# EasyEDA Pro project mainboard_c3_2026-10-25.epro

# Schematic Schematic1
Assembly Variant: Basic; Board Name: Board1; Create Date: 2026-08-22; Page Name: P1; Project Name: EMG_ESP32_Board; Schematic Name: Schematic1; Update Date: 2026-08-22; Company: 嘉立创EDA; Page Size: A4; Version: V1.0
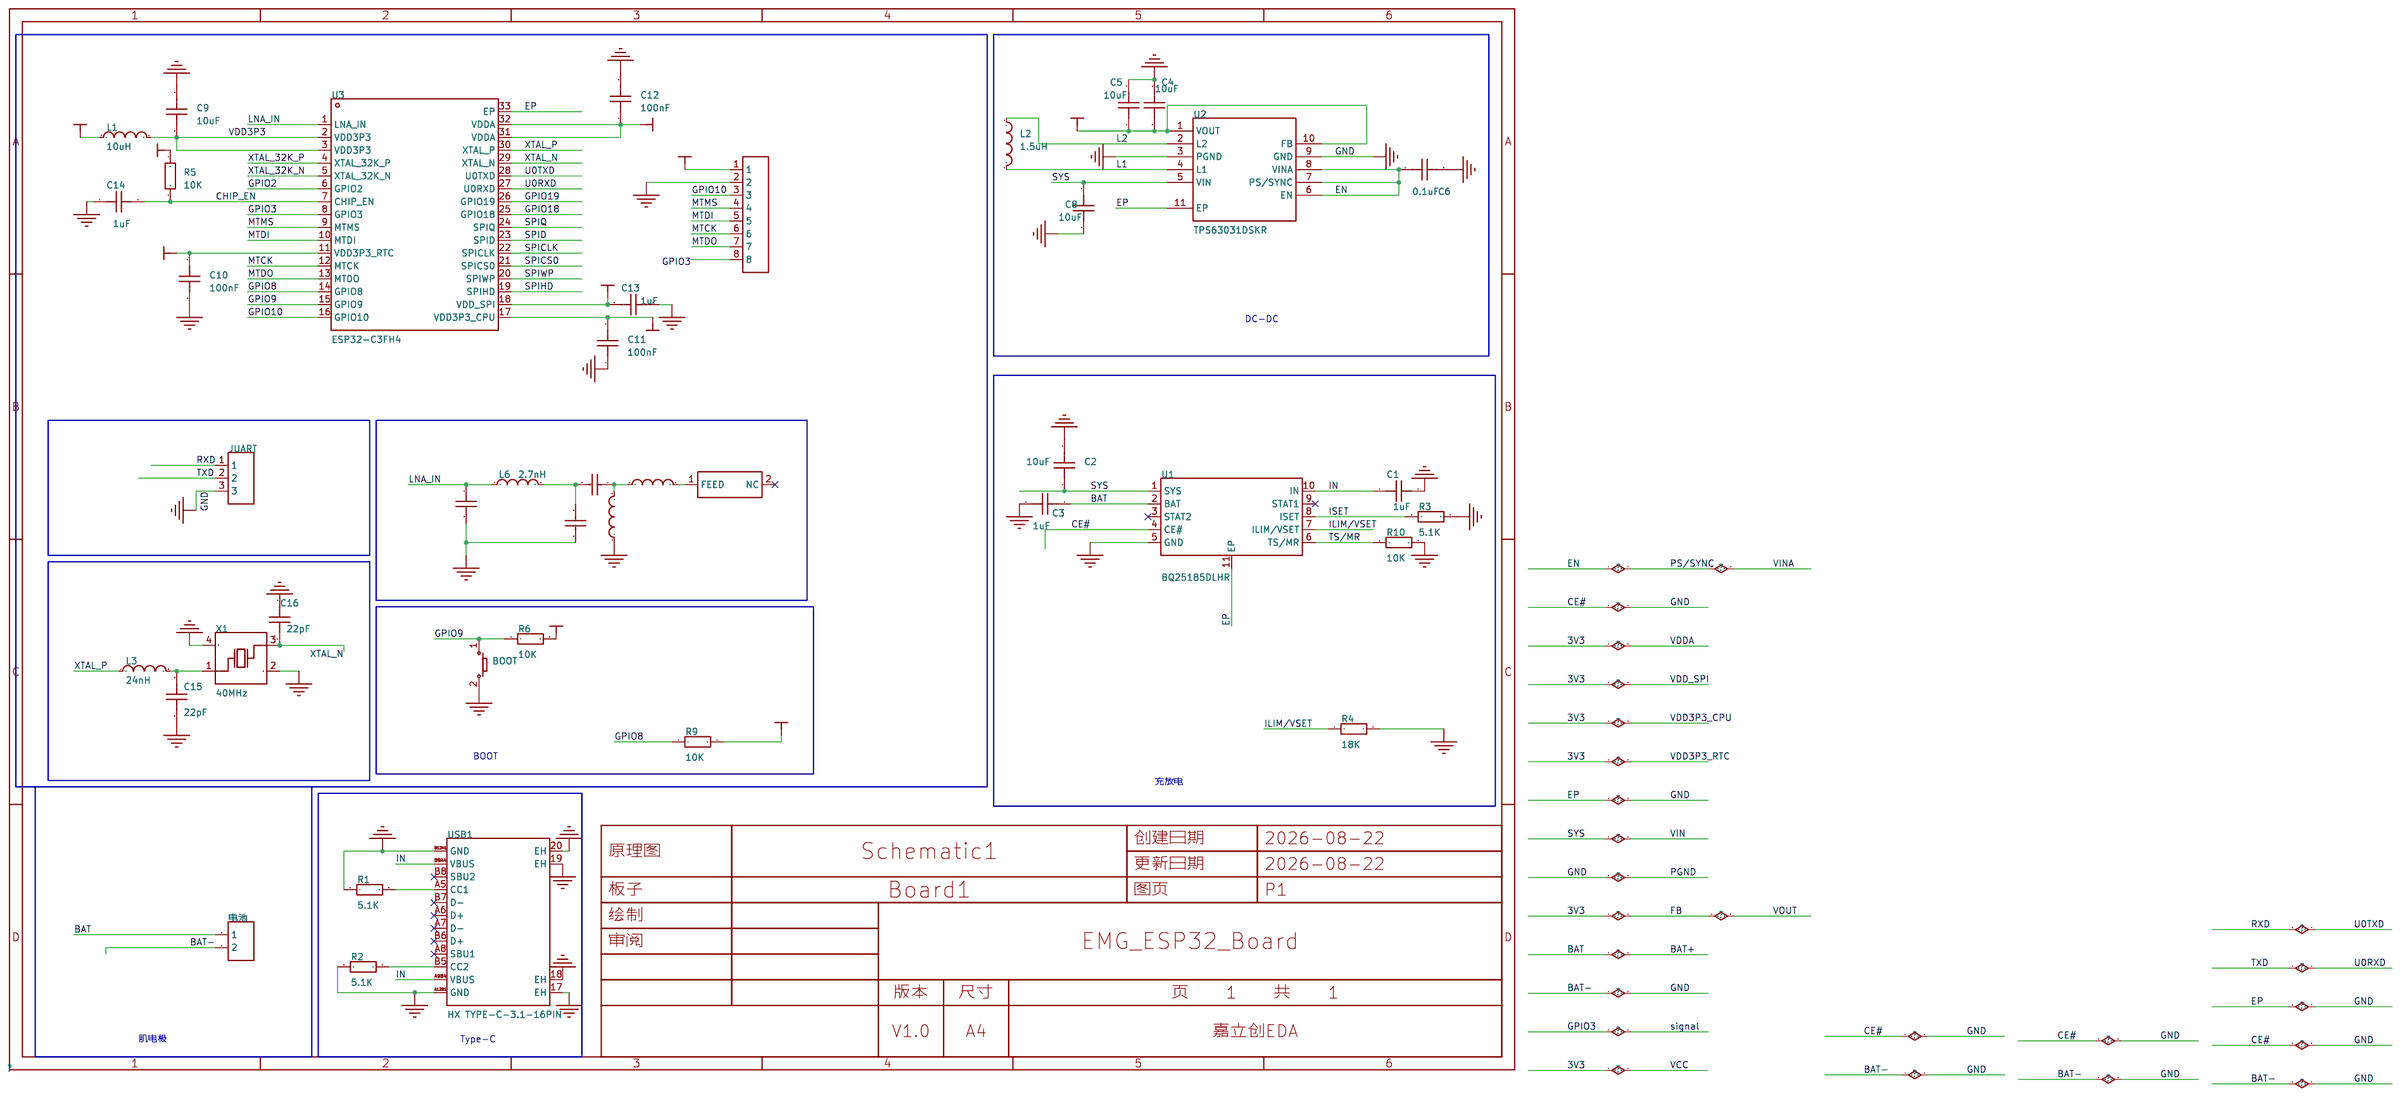
[diagram p0: schematic sheet]

## Parts
BOOT  -  [Key_SMD_3x4x2]
C1  1uF  [C0603]
C2  10uF  [C0603]
C3  1uF  [C0603]
C4  10uF  [C0603]
C5  10uF  [C0603]
C6  0.1uF  [C0603]
C7  1.2pF  [C0402]
C8  10uF  [C0603]
C9  10uF  [C0603]
C10  100nF  [C0603]
C11  100nF  [C0603]
C12  100nF  [C0603]
C13  1uF  [C0603]
C14  1uF  [C0603]
C15  22pF  [C0603]
C16  22pF  [C0603]
C18  1.2pF  [C0402]
C19  1.2pF  [C0402]
H1  -  [HDR-TH_8P-P2.54-V-F-1]
JUART  -  [HDR-TH_3P-P2.54-V-F]
L1  10uH  [IND-SMD_L4.0-W4.0_FNR40XXS]
L2  1.5uH  [L0603]
L3  24nH  [L0603]
L4  2450AT18B0100001E  [ANT-SMD_L3.2-W1.6]
L5  2.7nH  [L0402]
L6  2.7nH  [L0201]
R1  5.1K  [R0603]
R2  5.1K  [R0603]
R3  5.1K  [R0603]
R4  18K  [R0603]
R5  10K  [R0603]
R6  10K  [R0603]
R9  10K  [R0603]
R10  10K  [R0603]
U1  BQ25185DLHR  [WSON-10_L2.2-W2.0-P0.40-BL-EP_TI_DLH0010A]
U2  TPS63031DSKR  [SON-10_L2.5-W2.5-P0.50-TL-EP]
U3  ESP32-C3FH4  [QFN-32_L5.0-W5.0-P0.50-TL-EP3.7]
U4  3.3nH  [L0402]
USB1  HX TYPE-C-3.1-16PIN  [TYPE-C-SMD_HX-TYPE-C-16PIN]
X1  40MHz  [OSC-SMD_4P-L3.2-W2.5-BL_SIT8008BI]
电池  -  [HDR-TH_2P-P2.54-V-F]

## Library data of the parts
BOOT = Key_SMD_3x4x2: Supplier Footprint: SMD
C1-C6 C8-C16 = CAP_0603: Supplier Footprint: 0603
C7 C18 C19 = GJM1555C1H1R2WB01D: 容值:1.2pF;额定电压:50V;材质(温度系数):C0G;; LCSC Part Name: 1.2pF 50V; Supplier Part: C76899; Manufacturer: muRata(村田); Supplier Footprint: 0402; JLCPCB Part Class: Extended Part; Datasheet: https://atta.szlcsc.com/upload/public/pdf/source/20180326/C76899_D46909C5BA6C0CCEF2691B3FE0C3732C.pdf; Supplier: LCSC; Voltage Rated: 50V; Temperature Coefficient: C0G
H1 = HDR-F_2.54_1x8P: Supplier Part: C27438; Supplier Footprint: 插件
JUART = HDR-F_2.54_1x3P: Supplier Part: C541850; Supplier Footprint: 插件
L1 = FNR4030S100MT: 电感值:10uH;精度:±20%;额定电流:1.6A;饱和电流(Isat):2.4A;类型:磁胶屏蔽电感;; LCSC Part Name: 10uH ±20% 2.4A; Supplier Part: C167879; Manufacturer: cjiang(长江微电); Supplier Footprint: SMD,4x4mm; JLCPCB Part Class: Extended Part; Datasheet: https://item.szlcsc.com/datasheet/FNR4030S100MT/179262.html; Supplier: LCSC; Tolerance: ±20%; Current Rating: 1.6A; Current - Saturation(Isat): 2.4A; DC Resistance(DCR): 130mΩ; Type: 磁胶屏蔽电感
L2 L3 = L_0603
L4 = 2450AT18B0100001E: 天线类型:贴片天线;中心频率:2.45GHz;带宽:100MHz;增益:0.5dBi;功率:2W;; LCSC Part Name: 2.4GHz微型天线; Supplier Part: C6055600; Manufacturer: JOHANSON(约翰逊); Supplier Footprint: 1206; JLCPCB Part Class: Extended Part; Datasheet: https://item.szlcsc.com/datasheet/2450AT18B0100001E/6994739.html; Supplier: LCSC; Antenna Type: 贴片天线; Frequency(Center/Band): 2.45GHz; Bandwidth: 100MHz; Peak Gain: 0.5dBi; Impedance: 50Ω; Power: 2W; Operating Temperature: -45℃~+125℃; Length: 3.2mm; Width: 1.6mm; Height: 1.3mm
L5 = L-07C2N7SV6T: 电感值:2.7nH;精度:-;额定电流:300mA;饱和电流(Isat):-;直流电阻(DCR):170mΩ;; LCSC Part Name: 2.7nH 停产; Supplier Part: C2041435; Manufacturer: JOHANSON(约翰逊); Supplier Footprint: 0402; JLCPCB Part Class: Extended Part; Datasheet: https://item.szlcsc.com/datasheet/L-07C2N7SV6T/2132998.html; Supplier: LCSC; Current Rating: 300mA; DC Resistance(DCR): 170mΩ; Q @ Frequency: 8@100MHz; Frequency - Self Resonant: 21GHz; Type: 叠层电感
L6 = LQP03HQ2N7B02D: 电感值:2.7nH;额定电流:600mA;直流电阻(DCR):120mΩ;; LCSC Part Name: 2.7nH ±0.1nH; Supplier Part: C7216765; Manufacturer: muRata(村田); Supplier Footprint: 0201; JLCPCB Part Class: Extended Part; Datasheet: https://atta.szlcsc.com/upload/public/pdf/source/20230811/31877CD0D20902341EF7CE957B930534.pdf; Supplier: LCSC; Rated Current: 600mA; DC Resistance (DCR): 120mΩ; Q @ Freq: 20@500MHz; Frequency - Self Resonant: 9GHz
R1-R6 R9 R10 = Res_0603: Supplier Footprint: 0603
U1 = BQ25185DLHR: 工作电压:3V~18V;最大充电电流:1A;电池类型:锂电池；磷酸铁锂电池;电池节数:1;; LCSC Part Name: 单节1A独立线性电池充电器，具备电源路径、工厂模式和电池跟踪功能; Supplier Part: C19725033; Manufacturer: TI(德州仪器); Supplier Footprint: WSON-10-EP(2.2x2); JLCPCB Part Class: Extended Part; Datasheet: https://www.ti.com.cn/cn/lit/ds/symlink/bq25185.pdf?ts=1739415017761&ref_url=https%253A%252F%252Fwww.ti.com.cn%252Fproduct%252Fcn%252FBQ25185%253FkeyMatch%253Dbq25185%2526tisearch%253Duniversal_search; Supplier: LCSC; The Chip Type: 充电芯片; Voltage - Supply: 3V~18V; Charge Current - Max: 1A; Charging Saturation Voltage: 4.4V; End-Off Voltage: 2.2V; Type of Battery: 锂电池；磷酸铁锂电池; Number of Cells: 1; Operating Temperature: -40℃~+125℃; Battery Temperature Detection: 支持; Supply Current (Iq): 4uA
U2 = TPS63031DSKR: 功能类型:升降压型;工作电压:1.8V~5.5V;输出电压:3.3V;输出电流:900mA;输出类型:固定;; LCSC Part Name: 升降压型 900mA 1.8V~5.5V; Supplier Part: C15516; Manufacturer: TI(德州仪器); Supplier Footprint: SON-10-EP(2.5x2.5); JLCPCB Part Class: Extended Part; Datasheet: https://www.ti.com/cn/lit/gpn/tps63031; Supplier: LCSC; Function: 升降压型; Voltage - Supply: 1.8V~5.5V; Output Voltage: 3.3V; Output Current: 900mA; Frequency - Switching: 2.4MHz; Operating Temperature: -40℃~+125℃@(TJ); Synchronous Rectifier: 是; Number of Outputs: 1; Topology: 降压-升压式; Quiescent Current: 25uA; Switch tube (built-in/external): 内置; Output Type: 固定; Features: 轻载高效模式；频率同步；过流保护；负载断开
U3 = ESP32-C3FH4: ESP32-C3 是一款低功耗、高集成度的 MCU 系统级芯片 (SoC)，集成 2.4 GHz Wi-Fi 和低功耗蓝牙 (Bluetooth®LE) 无线通信。; LCSC Part Name: 不带固件 ESP32-C3 是一款低功耗、高集成度的 MCU 系统级芯片 (SoC)，集成 2.4 GHz Wi-Fi 和低功耗蓝牙 (Bluetooth® LE) 无线通信。; Supplier Part: C2858491; Manufacturer: ESPRESSIF(乐鑫); Supplier Footprint: QFN-32-EP(5x5); JLCPCB Part Class: Extended Part; Datasheet: https://item.szlcsc.com/datasheet/ESP32-C3FH4/3060870.html; Supplier: LCSC
U4 = LRC0402CS3N3GV001T: 电感值:3.3nH;精度:-;额定电流:300mA;饱和电流(Isat):-;直流电阻(DCR):190mΩ;; LCSC Part Name: ±0.3nH 旧型号：L-07C3N3SV6T; Supplier Part: C5338661; Manufacturer: JOHANSON(约翰逊); Supplier Footprint: 0402; JLCPCB Part Class: Extended Part; Datasheet: https://item.szlcsc.com/datasheet/LRC0402CS3N3GV001T/6106478.html; Supplier: LCSC; Current Rating: 300mA; DC Resistance(DCR): 190mΩ; Q @ Frequency: 8@100MHz; Frequency - Self Resonant: 8.5GHz; Type: 叠层电感
USB1 = HX TYPE-C-3.1-16PIN: 连接器类型:Type-C;协议标准:USB 3.1;公母:母;安装方式:卧贴;触点数量:16P;端口数量:1;额定电流 - 电源:3A;工作温度:-30℃~+80℃;; LCSC Part Name: Type-C 母 卧贴; Supplier Part: C18357551; Manufacturer: hanxia(韩下); Supplier Footprint: SMD; JLCPCB Part Class: Extended Part; Datasheet: https://item.szlcsc.com/datasheet/HX%2520TYPE-C-3.1-16PIN/19545721.html; Supplier: LCSC; Connector Type: Type-C; Protocol Standard: USB 3.1; Gender: 母; Mounting Type: 卧贴; Number of Contacts: 16P; Number of Ports: 1; Current Rating-Power: 3A; Voltage Rating: 20V; Connect-Disconnect Life: 1万次; Center Height: 1.68mm; Length: 7.35mm; Detection color: 黑色; Operating Temperature: -30℃~+80℃
X1 = X322540MPB4SI: 晶振类型:贴片晶振;频率:40MHz;常温频差:±10ppm;负载电容:15pF;频率稳定度:±20ppm;; LCSC Part Name: YSX321SL 40MHZ 4P 3225 15PF ±10PPM -40~85℃ (±20PPM); Supplier Part: C9010; Manufacturer: YXC(扬兴晶振); Supplier Footprint: SMD3225-4P; JLCPCB Part Class: Extended Part; Datasheet: https://item.szlcsc.com/datasheet/X322540MPB4SI/9530.html; Supplier: LCSC; Type: 贴片晶振; Normal temperature Frequency Tolerance: ±10ppm; Load Capacitance: 15pF; Frequency Stability: ±20ppm; Equivalent Series Resistance(ESR): 40Ω; Operating Temperature: -40℃~+85℃
电池 = HDR-F_2.54_1x2P: Supplier Part: C49661; Supplier Footprint: 插件

## Nets
3V3: C4.1 C5.1 C10.2 C11.2 C12.1 C13.2 H1.1 L1.1 R5.1 R6.2 R9.2 U2.1(VOUT) U2.10(FB) U3.11(VDD3P3_RTC) U3.17(VDD3P3_CPU) U3.18(VDD_SPI) U3.31(VDDA) U3.32(VDDA)
GND: BOOT.2 C1.2 C2.2 C3.1 C4.2 C5.2 C6.2 C8.1 C9.2 C10.1 C11.1 C12.2 C13.1 C14.1 C15.2 C16.2 C18.2 C19.2 H1.2 JUART.3 L5.1 R1.1 R2.1 R3.2 R4.2 R10.2 U1.4(CE#) U1.5(GND) U1.11(EP) U2.3(PGND) U2.9(GND) U2.11(EP) U3.33(EP) USB1.17(EH) USB1.18(EH) USB1.19(EH) USB1.20(EH) USB1.A12B1(GND) USB1.B12A1(GND) X1.2(GND) X1.4(GND) 电池.2
VDD3P3: C9.1 L1.2 U3.2(VDD3P3) U3.3(VDD3P3)
BAT: C3.2 U1.2(BAT) 电池.1
CHIP_EN: C14.2 R5.2 U3.7(CHIP_EN)
EN: C6.1 U2.6(EN) U2.7(PS/SYNC) U2.8(VINA)
GPIO2: U3.6(GPIO2)
GPIO3: H1.8 U3.8(GPIO3)
GPIO8: R9.1 U3.14(GPIO8)
GPIO9: BOOT.1 R6.1 U3.15(GPIO9)
GPIO10: H1.3 U3.16(GPIO10)
GPIO18: U3.25(GPIO18)
GPIO19: U3.26(GPIO19)
ILIM/VSET: R4.1 U1.7(ILIM/VSET)
IN: C1.1 U1.10(IN) USB1.A9B4(VBUS) USB1.B9A4(VBUS)
ISET: R3.1 U1.8(ISET)
L1: L2.2 U2.4(L1)
L2: L2.1 U2.2(L2)
LNA_IN: C18.1 L6.1 U3.1(LNA_IN)
MTCK: H1.6 U3.12(MTCK)
MTDI: H1.5 U3.10(MTDI)
MTDO: H1.7 U3.13(MTDO)
MTMS: H1.4 U3.9(MTMS)
RXD: JUART.1 U3.28(U0TXD)
SPICLK: U3.22(SPICLK)
SPICS0: U3.21(SPICS0)
SPID: U3.23(SPID)
SPIHD: U3.19(SPIHD)
SPIQ: U3.24(SPIQ)
SPIWP: U3.20(SPIWP)
SYS: C2.1 C8.2 U1.1(SYS) U2.5(VIN)
TS/MR: R10.1 U1.6(TS/MR)
TXD: JUART.2 U3.27(U0RXD)
XTAL_32K_N: U3.5(XTAL_32K_N)
XTAL_32K_P: U3.4(XTAL_32K_P)
XTAL_N: C16.1 U3.29(XTAL_N) X1.3(OSC2)
XTAL_P: L3.1 U3.30(XTAL_P)
$1N344: C15.1 L3.2 X1.1(OSC1)
$1N356: R1.2 USB1.A5(CC1)
$1N358: R2.2 USB1.B5(CC2)
$1N1447: L4.1(FEED) U4.2
$1N1540: C7.1 L5.2 U4.1
$1N1544: C7.2 C19.1 L6.2

Not connected (* = marked no-connect by the designer): L4 2(NC)*; U1 3(STAT2)* 9(STAT1)*; USB1 A6(D+)* A7(D-)* A8(SBU1)* B6(D+)* B7(D-)* B8(SBU2)*

## Notes on the sheet
- DC-DC
- BOOT
- 充放电
- 肌电极
- Type-C

# Board PCB1
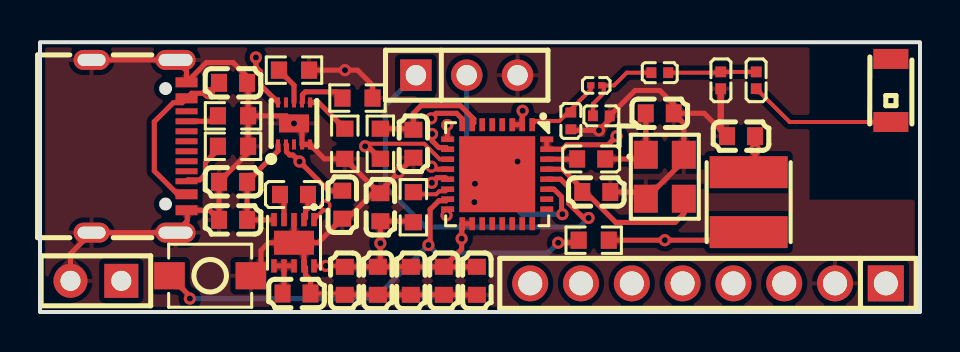
[diagram p1: board, top side]
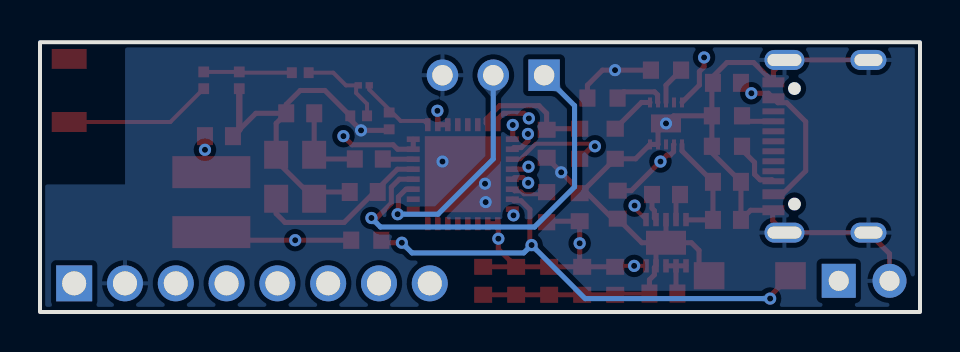
[diagram p2: board, bottom side, seen from below]

Outline 44 x 13.5 mm; copper layers: Top Layer, Inner1, Inner2, Inner3, Inner4, Bottom Layer. Coordinates in mm from the lower left corner of the outline.
Outline path: rectangle 0,13.5 44,0
Stack: Top Layer 0.035mm Outer layer thickness 1oz / Dielectric1 0.0994mm 3313 RC57% 4.2mil / Inner1 0.0152mm Inner layer thickness / Dielectric2 0.55mm 0.55mm H/H No copper / Inner2 0.0152mm Inner layer thickness / Dielectric3 0.1088mm 2116 RC54% 4.9mil / Inner3 0.0152mm Inner layer thickness / Dielectric4 0.55mm 0.55mm H/H No copper / Inner4 0.0152mm Inner layer thickness / Dielectric5 0.0994mm 3313 RC57% 4.2mil / Bottom Layer 0.035mm Outer layer thickness 1oz

## Design rules (mm)
spacing copperThickness1oz (default): track to track 0.102, other pairs 0.152 to 0.3
spacing copperThickness2oz: track to track 0.203, other pairs 0.152 to 0.3
spacing Plane_innerPlane: track to track 0.102, other pairs 0.152 to 0.3
spacing Copper_copperRegion: track to track 0.102, other pairs 0.152 to 0.3
spacing Copper_copperRegion_copperThickness1oz: track to track 0.102, other pairs 0.152 to 0.3
spacing Copper_copperRegion_Copper_copperRegion: track to track 0.102, other pairs 0.152 to 0.3
track width copperThickness1oz (default): min 0.127, default 0.254, max 2.54
track width copperThickness2oz: min 0.203, default 0.254, max 2.54
differential pair differentialPair (default): width min 0.127, default 0.254, max 2.54; gap min 0.152, default 0.152
net GND uses copperRegion_copperThickness1oz
net 3V3 uses copperRegion_copperThickness1oz
pour e513 uses Copper_copperRegion_copperThickness1oz
pour e611 uses Copper_copperRegion_copperThickness1oz
pour e636 uses Copper_copperRegion_copperThickness1oz
pour e641 uses Copper_copperRegion_copperThickness1oz
pour e666 uses Copper_copperRegion_copperThickness1oz
pour e697 uses Copper_copperRegion_copperThickness1oz
pour e726 uses Copper_copperRegion_copperThickness1oz

## Placement (name value [footprint] x y rotation side)
BOOT  -  [Key_SMD_3x4x2]  8.51 1.82 0 top
C1  1uF  [C0603]  9.65 11.47 0 top
C2  10uF  [C0603]  9.65 6.52 180 top
C3  1uF  [C0603]  15.11 5.37 90 top
C4  10uF  [C0603]  15.24 1.56 270 top
C5  10uF  [C0603]  16.89 1.56 270 top
C6  0.1uF  [C0603]  12.83 0.93 0 top
C7  1.2pF  [C0402]  30.99 11.98 180 top
C8  10uF  [C0603]  9.65 4.61 0 top
C9  10uF  [C0603]  35.05 8.8 180 top
C10  100nF  [C0603]  17.02 5.25 270 top
C11  100nF  [C0603]  21.84 1.56 90 top
C12  100nF  [C0603]  18.54 1.56 270 top
C13  1uF  [C0603]  20.19 1.56 90 top
C14  1uF  [C0603]  18.67 8.42 90 top
C15  22pF  [C0603]  30.99 9.94 0 top
C16  22pF  [C0603]  27.81 6.01 0 top
C18  1.2pF  [C0402]  26.54 9.56 270 top
C19  1.2pF  [C0402]  28.07 9.82 0 top
H1  -  [HDR-TH_8P-P2.54-V-F-1]  33.4 1.44 180 top
JUART  -  [HDR-TH_3P-P2.54-V-F]  21.34 11.85 0 top
L1  10uH  [IND-SMD_L4.0-W4.0_FNR40XXS]  35.43 5.5 90 top
L2  1.5uH  [L0603]  12.7 5.88 180 top
L3  24nH  [L0603]  27.56 7.66 0 top
L4  2450AT18B0100001E  [ANT-SMD_L3.2-W1.6]  42.54 11.09 90 top
L5  2.7nH  [L0402]  34.04 11.59 90 top
L6  2.7nH  [L0201]  27.81 11.34 0 top
R1  5.1K  [R0603]  9.65 9.82 180 top
R2  5.1K  [R0603]  9.65 8.29 180 top
R3  5.1K  [R0603]  12.7 12.1 0 top
R4  18K  [R0603]  15.88 10.71 0 top
R5  10K  [R0603]  17.02 8.42 90 top
R6  10K  [R0603]  27.69 3.59 0 top
R9  10K  [R0603]  18.67 5.25 270 top
R10  10K  [R0603]  15.24 8.42 270 top
U1  BQ25185DLHR  [WSON-10_L2.2-W2.0-P0.40-BL-EP_TI_DLH0010A]  12.7 9.44 0 top
U2  TPS63031DSKR  [SON-10_L2.5-W2.5-P0.50-TL-EP]  12.7 3.47 270 top
U3  ESP32-C3FH4  [QFN-32_L5.0-W5.0-P0.50-TL-EP3.7]  22.86 6.9 270 top
U4  3.3nH  [L0402]  35.81 11.59 270 top
USB1  HX TYPE-C-3.1-16PIN  [TYPE-C-SMD_HX-TYPE-C-16PIN]  4.95 8.29 270 top
X1  40MHz  [OSC-SMD_4P-L3.2-W2.5-BL_SIT8008BI]  31.24 6.77 270 top
电池  -  [HDR-TH_2P-P2.54-V-F]  2.79 1.56 180 top

## Footprints (pads in the part's own frame, mm; a bottom-side part is the same pattern mirrored in y, then rotated)
ANT-SMD_L3.2-W1.6
  rect 1x1.75 smd: 1(-1.578,0) 2(1.578,0)
C0402
  rect 0.5x0.54 smd: 1(-0.42,0) 2(0.42,0)
C0603
  rect 0.8x0.9 smd: 1(-0.7,0) 2(0.7,0)
HDR-TH_2P-P2.54-V-F
  rect 1.7x1.7 hole 1: 1(-1.27,0)
  round 1.7 hole 1: 2(1.27,0)
HDR-TH_3P-P2.54-V-F
  rect 1.575x1.575 hole 1.02: 1(-2.54,0)
  round 1.575 hole 1.02: 2(0,0) 3(2.54,0)
HDR-TH_8P-P2.54-V-F-1
  rect 1.8x1.8 hole 1.2: 1(-8.89,0)
  round 1.8 hole 1.2: 2(-6.35,0) 3(-3.81,0) 4(-1.27,0) 5(1.27,0) 6(3.81,0) 7(6.35,0) 8(8.89,0)
IND-SMD_L4.0-W4.0_FNR40XXS
  rect 1.6x3.9 smd: 1(-1.5,0) 2(1.5,0)
Key_SMD_3x4x2
  rect 1.53x1.36 smd: 1(-2.035,0) 2(2.035,0)
L0201
  rect 0.368x0.324 smd: 1(-0.275,0) 2(0.275,0)
L0402
  rect 0.54x0.54 smd: 1(-0.42,0) 2(0.42,0)
L0603
  rect 0.8x0.864 smd: 1(-0.7,0) 2(0.7,0)
OSC-SMD_4P-L3.2-W2.5-BL_SIT8008BI
  rect 1.4x1.2 smd: 1(-1.1,-0.95) 2(1.1,-0.95) 3(1.1,0.95) 4(-1.1,0.95)
QFN-32_L5.0-W5.0-P0.50-TL-EP3.7
  rect 0.65x0.28 smd: 1(-2.478,1.75) 2(-2.478,1.25) 3(-2.478,0.75) 4(-2.478,0.25) 5(-2.478,-0.25) 6(-2.478,-0.75) 7(-2.478,-1.25) 8(-2.478,-1.75) 17(2.478,-1.75) 18(2.478,-1.25) 19(2.478,-0.75) 20(2.478,-0.25) 21(2.478,0.25) 22(2.478,0.75) 23(2.478,1.25) 24(2.478,1.75)
  rect 0.28x0.65 smd: 9(-1.75,-2.478) 10(-1.25,-2.478) 11(-0.75,-2.478) 12(-0.25,-2.478) 13(0.25,-2.478) 14(0.75,-2.478) 15(1.25,-2.478) 16(1.75,-2.478) 25(1.75,2.478) 26(1.25,2.478) 27(0.75,2.478) 28(0.25,2.478) 29(-0.25,2.478) 30(-0.75,2.478) 31(-1.25,2.478) 32(-1.75,2.478)
  rect 3.8x3.8 smd: 33(0,0)
R0603
  rect 0.806x0.864 smd: 1(-0.753,0) 2(0.753,0)
SON-10_L2.5-W2.5-P0.50-TL-EP
  rect 0.665x0.28 smd: 1(-1.157,1) 2(-1.157,0.5) 3(-1.157,0) 4(-1.157,-0.5) 5(-1.157,-1) 6(1.157,-1) 7(1.157,-0.5) 8(1.157,0) 9(1.157,0.5) 10(1.157,1)
  rect 1.2x2 smd: 11(0,0)
TYPE-C-SMD_HX-TYPE-C-16PIN
  oval 1x2 hole 0.6x1.7: 17(-4.32,1.825) 20(4.32,1.825)
  oval 1x1.8 hole 0.6x1.4: 18(-4.32,-2.376) 19(4.32,-2.376)
  rect 0.3x1.1 smd: A5(-1.25,2.374) A6(-0.25,2.374) A7(0.25,2.374) A8(1.25,2.376) B5(1.75,2.374) B6(0.75,2.374) B7(-0.75,2.374) B8(-1.75,2.376)
  rect 0.5x1.1 smd: A9B4(2.4,2.375) A12B1(3.2,2.375) B9A4(-2.4,2.375) B12A1(-3.2,2.375)
WSON-10_L2.2-W2.0-P0.40-BL-EP_TI_DLH0010A
  rect 0.2x0.5 smd: 1(-0.8,-1.05) 2(-0.4,-1.05) 3(0,-1.05) 4(0.4,-1.05) 5(0.8,-1.05) 6(0.8,1.05) 7(0.4,1.05) 8(0,1.05) 9(-0.4,1.05) 10(-0.8,1.05)
  rect 1.5x0.9 smd: 11(0,0)

## Nets
As in the schematic.

Pads without a net: L4 2; U1 3 9; USB1 A6 A7 A8 B6 B7 B8

## Via types
v1: diameter 0.61, hole 0.305, Top Layer to Bottom Layer, 30 vias

## Routing (per net, layer and track width the routed paths; a pad name or vN(x,y) marks a point on that pad's centre or on a via; arc(x,y) is an arc through that point)
3V3: length 69.7
  Top Layer w0.2: C4.1 15.19,2.31 v1(14.29,2.31) U2.10 ; U2.1 14.27,5.19 v1(14.27,5.33) ; v1(16.26,8.29) 16.38,8.42 19.21,8.42 19.99,7.65 U3.11
  Top Layer w0.254: C4.1 C5.1 ; C5.1 17.02,2.39 v1(17.02,3.44) C10.2 18.62,4.55 R9.2 ; C5.1 C12.1 C13.2 ; L1.1 35.03,3.59 v1(31.24,3.59) R6.2 ; C13.2 C11.2 ; C13.2 21.08,3.15 v1(21.08,3.67) 21.08,4.39 U3.17 U3.18 ; v1(28.83,8.8) 28.4,8.37 26.34,8.37 26.12,8.15 U3.31 U3.32 ; v1(16.26,8.29) 16.39,8.29 R5.1
  Inner2 w0.4: v1(21.08,3.67) 23.7,3.67 v1(28.83,8.8) 29.46,8.8 31.24,7.02 v1(31.24,3.59) 40.13,3.59 H1.1 ; v1(14.29,2.31) 14.29,5.3 v1(14.27,5.33) ; v1(17.02,3.44) 17.02,7.53 v1(16.26,8.29)
GND: length 118.1
  Top Layer w0.2: C4.2 15.18,0.93 C6.2
  Top Layer w0.254: U2.11 13.91,3.47 C3.1 ; U2.11 11.43,3.47 11.05,3.09 11.05,2.32 BOOT.2 ; U2.11 U2.3 ; U2.11 13.2,2.97 U2.9 13.28,2.23 13.28,1.86 13.53,1.62 C6.2 ; R1.1 12.32,9.82 v1(12.7,9.44) 13.1,9.04 U1.4 U1.5 14.22,7.67 R10.2 16.96,5.94 ; R1.1 R2.1 10.41,7.97 C2.2 C8.1 8.47,5.09 USB1.A12B1 ; R1.1 10.41,11.41 C1.2 10.35,11.78 9.65,12.48 8.32,12.48 7.33,11.49 7.33,12.06 USB1.17 USB1.18 ; C18.2 26.6,9.09 v1(27.95,9.09) 28.49,9.63 C19.2 29.76,11.09 30.99,11.09 31.69,10.39 C15.2 ; 16.96,5.94 17.02,5.94 17.02,6.07 v1(17.94,6.99) C14.1 ; 16.96,5.94 16.64,5.94 15.24,4.55 ; v1(21.75,6.42) 21.75,5.53 v1(21.72,5.5) ; C16.2 29.95,6.01 30.29,5.67 32.19,7.57 X1.4 32.19,9.44 C15.2 ; C11.1 C13.1 C12.2 C5.2 C4.2 ; 电池.2 1.52,2.92 2.58,3.97 6.78,3.97 7.37,4.56 7.37,4.86 ; C15.2 33.21,9.94 34.04,9.12 ; R4.2 16.63,11.35 15.88,12.1 v1(15.25,12.1) R3.2
  Top Layer w0.32: L5.1 34.04,9.12 C9.2
  Inner1 w0.254: v1(15.25,12.1) 15.25,11.99 v1(12.7,9.44) ; v1(21.75,6.42) 21.75,5.53 v1(21.72,5.5) 19.3,5.5 17.94,6.86 v1(17.94,6.99) ; JUART.3 22.99,10.96 22.99,8.42 v1(23.88,7.53) ; 26.39,7.53 v1(27.95,9.09)
  Inner1 w0.4: H1.2 33.66,7.53 v1(23.88,7.53)
VDD3P3: length 15.3
  Top Layer w0.254: C9.1 v1(35.75,8.12) 35.75,7.32 L1.2 ; v1(24.13,10.07) 24.11,10.05 U3.2 U3.3
  Inner4 w0.254: v1(24.13,10.07) 33.91,10.07 35.56,8.42
BAT: length 15.4
  Top Layer w0.254: U1.2 12.32,8.37 12.32,8.02 12.48,7.86 12.65,7.86 v1(12.98,7.53) 14.43,6.07 C3.2
  Inner2 w0.4: v1(12.98,7.53) 7.01,1.56 电池.1
CHIP_EN: length 6.3
  Top Layer w0.254: R5.2 18.62,9.17 C14.2 18.67,9.94 19.05,10.33 21.02,10.33 21.69,9.65 21.69,9.45 U3.7
EN: length 2.4
  Top Layer w0.254: C6.1 12.2,1 U2.7 ; U2.6 U2.7 ; U2.7 U2.8
GPIO3: length 19.8
  Top Layer w0.254: U3.8 21.11,9.66 20.83,9.94 19.81,9.94 v1(19.56,9.69)
  Inner4 w0.254: H1.8 24.38,1.31 17.27,1.31 15.95,2.63 15.95,6.08 v1(19.56,9.69)
GPIO8: length 1.9
  Top Layer w0.2: R9.1 18.77,5.89 19.81,5.89 19.95,6.04 20.27,6.04 U3.14
GPIO9: length 25.8
  Top Layer w0.254: v1(19.42,3.35) 19.5,3.44 19.5,5.13 19.94,5.56 20.3,5.56 U3.15 ; v1(7.49,0.67) 7.49,0.8 BOOT.1 ; v1(25.91,3.47) 26.81,3.47 R6.1 26.68,3.85
  Bottom Layer w0.254: v1(7.49,0.67) 16.74,0.67 v1(19.42,3.35) 19.81,2.96 25.4,2.96 v1(25.91,3.47)
GPIO10: length 20.1
  Top Layer w0.254: v1(20.33,4.84) 20.38,4.89 U3.16
  Inner3 w0.254: v1(20.33,4.84) 24.36,4.84 25.4,5.88 33.78,5.88 37.21,2.45 H1.3
ILIM/VSET: length 2.6
  Top Layer w0.254: U1.7 13.12,10.51 13.12,10.87 13.27,11.02 14.81,11.02 R4.1
IN: length 14.4
  Top Layer w0.254: C1.1 v1(8.43,10.95) 7.58,10.95 7.11,10.47 6.66,10.47 5.72,9.52 5.72,7.06 6.88,5.89 USB1.A9B4 ; v1(10.79,12.74) 10.79,12.27 11.03,12.03 11.03,11.36 U1.10
  Inner2 w0.4: v1(10.79,12.74) 9,10.95 v1(8.43,10.95)
ISET: length 1.9
  Top Layer w0.254: R3.1 12.7,11.35 U1.8
L1: length 1.3
  Top Layer w0.254: U2.4 12.2,5.68 L2.2
L2: length 1.3
  Top Layer w0.254: U2.2 13.28,4.71 13.28,5.07 13.4,5.19 L2.1
LNA_IN: length 3.9
  Top Layer w0.2: U3.1 24.8,9.56 25.97,9.56 27.54,11.13 L6.1
MTCK: length 13
  Top Layer w0.254: 19.86,7.15 U3.12
  Inner4 w0.254: H1.6 26.72,4.31 25.88,4.31 22.96,7.23 19.62,7.23 v1(19.57,7.27)
MTDI: length 16.9
  Top Layer w0.254: U3.10 20.3,8.23 19.94,8.23 19.6,8.57 v1(19.6,8.91)
  Inner4 w0.254: v1(19.6,8.91) 20.35,8.17 25.4,8.17 H1.5
MTDO: length 14.6
  Top Layer w0.254: 20.28,6.73 19.85,6.73 v1(19.59,6.46)
  Inner4 w0.254: 20.15,6.73 19.8,6.73 19.59,6.52 v1(19.59,6.46) 18.29,5.16 18.29,3.59 19.27,2.61 25,2.61 26.18,1.44 H1.7
MTMS: length 18.3
  Top Layer w0.254: v1(20.36,9.36) 20.36,8.67 U3.9
  Inner4 w0.254: v1(20.36,9.36) 26.75,9.36 H1.4
RXD: length 20.8
  Top Layer w0.254: v1(27.43,4.71) 27.17,4.71 26.43,5.44 26.43,6.25 26.03,6.65 U3.28
  Bottom Layer w0.254: JUART.1 17.27,10.33 17.27,6.26 19.28,4.25 26.98,4.25 v1(27.43,4.71)
SYS: length 5.8
  Top Layer w0.254: U2.5 11.69,4.61 C8.2 C2.1 11.9,8.06 U1.1
TS/MR: length 2.3
  Top Layer w0.254: U1.6 13.93,10.49 R10.1
TXD: length 12.2
  Top Layer w0.254: v1(26.12,4.89) 26.08,4.94 26.08,5.77 25.7,6.15 U3.27
  Bottom Layer w0.254: 21.34,12.1 21.34,7.66 24.1,4.89 v1(26.12,4.89)
XTAL_N: length 8.9
  Top Layer w0.254: 32.19,5.67 32.19,4.92 31.75,4.48 28.79,4.48 26.13,7.15 U3.29
XTAL_P: length 1.5
  Top Layer w0.254: L3.1 26.85,7.65 U3.30
$1N344: length 4.2
  Top Layer w0.254: C15.1 30.29,9.94 X1.1 30.08,7.66 L3.2
$1N356: length 1.7
  Top Layer w0.254: USB1.A5 8.62,9.54 R1.2
$1N358: length 2.7
  Top Layer w0.254: USB1.B5 7.4,6.61 7.99,6.61 8.27,6.89 8.27,7.49 8.9,8.11 R2.2
$1N1447: length 7.4
  Top Layer w0.2: U4.2 37.48,9.51 L4.1
$1N1540: length 4.4
  Top Layer w0.2: U4.1 L5.2 34,11.98 C7.1
$1N1544: length 4.4
  Top Layer w0.2: L6.2 28.7,11.34 29.34,11.98 C7.2 ; C19.1 27.65,10.41 28.19,10.96 28.19,11.21

## Copper pours and planes (outline as drawn; the poured copper is in the pictures)
3V3 on Inner2: -2.29,18.45 46.99,18.45 46.99,-6.57 -2.29,-6.57
GND on Top Layer: -1.02,15.91 46.48,15.91 46.48,-3.01 -1.02,-3.01
GND on Bottom Layer: -2.92,16.42 51.69,16.42 51.69,-1.61 -2.92,-1.61
GND on Inner1: -2.54,16.42 52.58,16.42 52.58,-5.93 -2.54,-5.93
GND on Inner3: -3.81,17.82 50.04,17.82 50.04,-5.3 -3.81,-5.3
GND on Inner4: -4.19,17.82 50.16,17.82 50.16,-4.41 -4.19,-4.41
GND on Inner4: -2.67,16.67 52.07,16.67 52.07,-5.55 -2.67,-5.55

Small or netless copper shapes (teardrops, artwork), in the pictures only: 196 on Top Layer, 8 on Bottom Layer, 12 on Inner1, 14 on Inner2, 2 on Inner3, 12 on Inner4
